# EasyEDA Pro project EVA_RT.eprj, board EVA_RT_JLCPCB
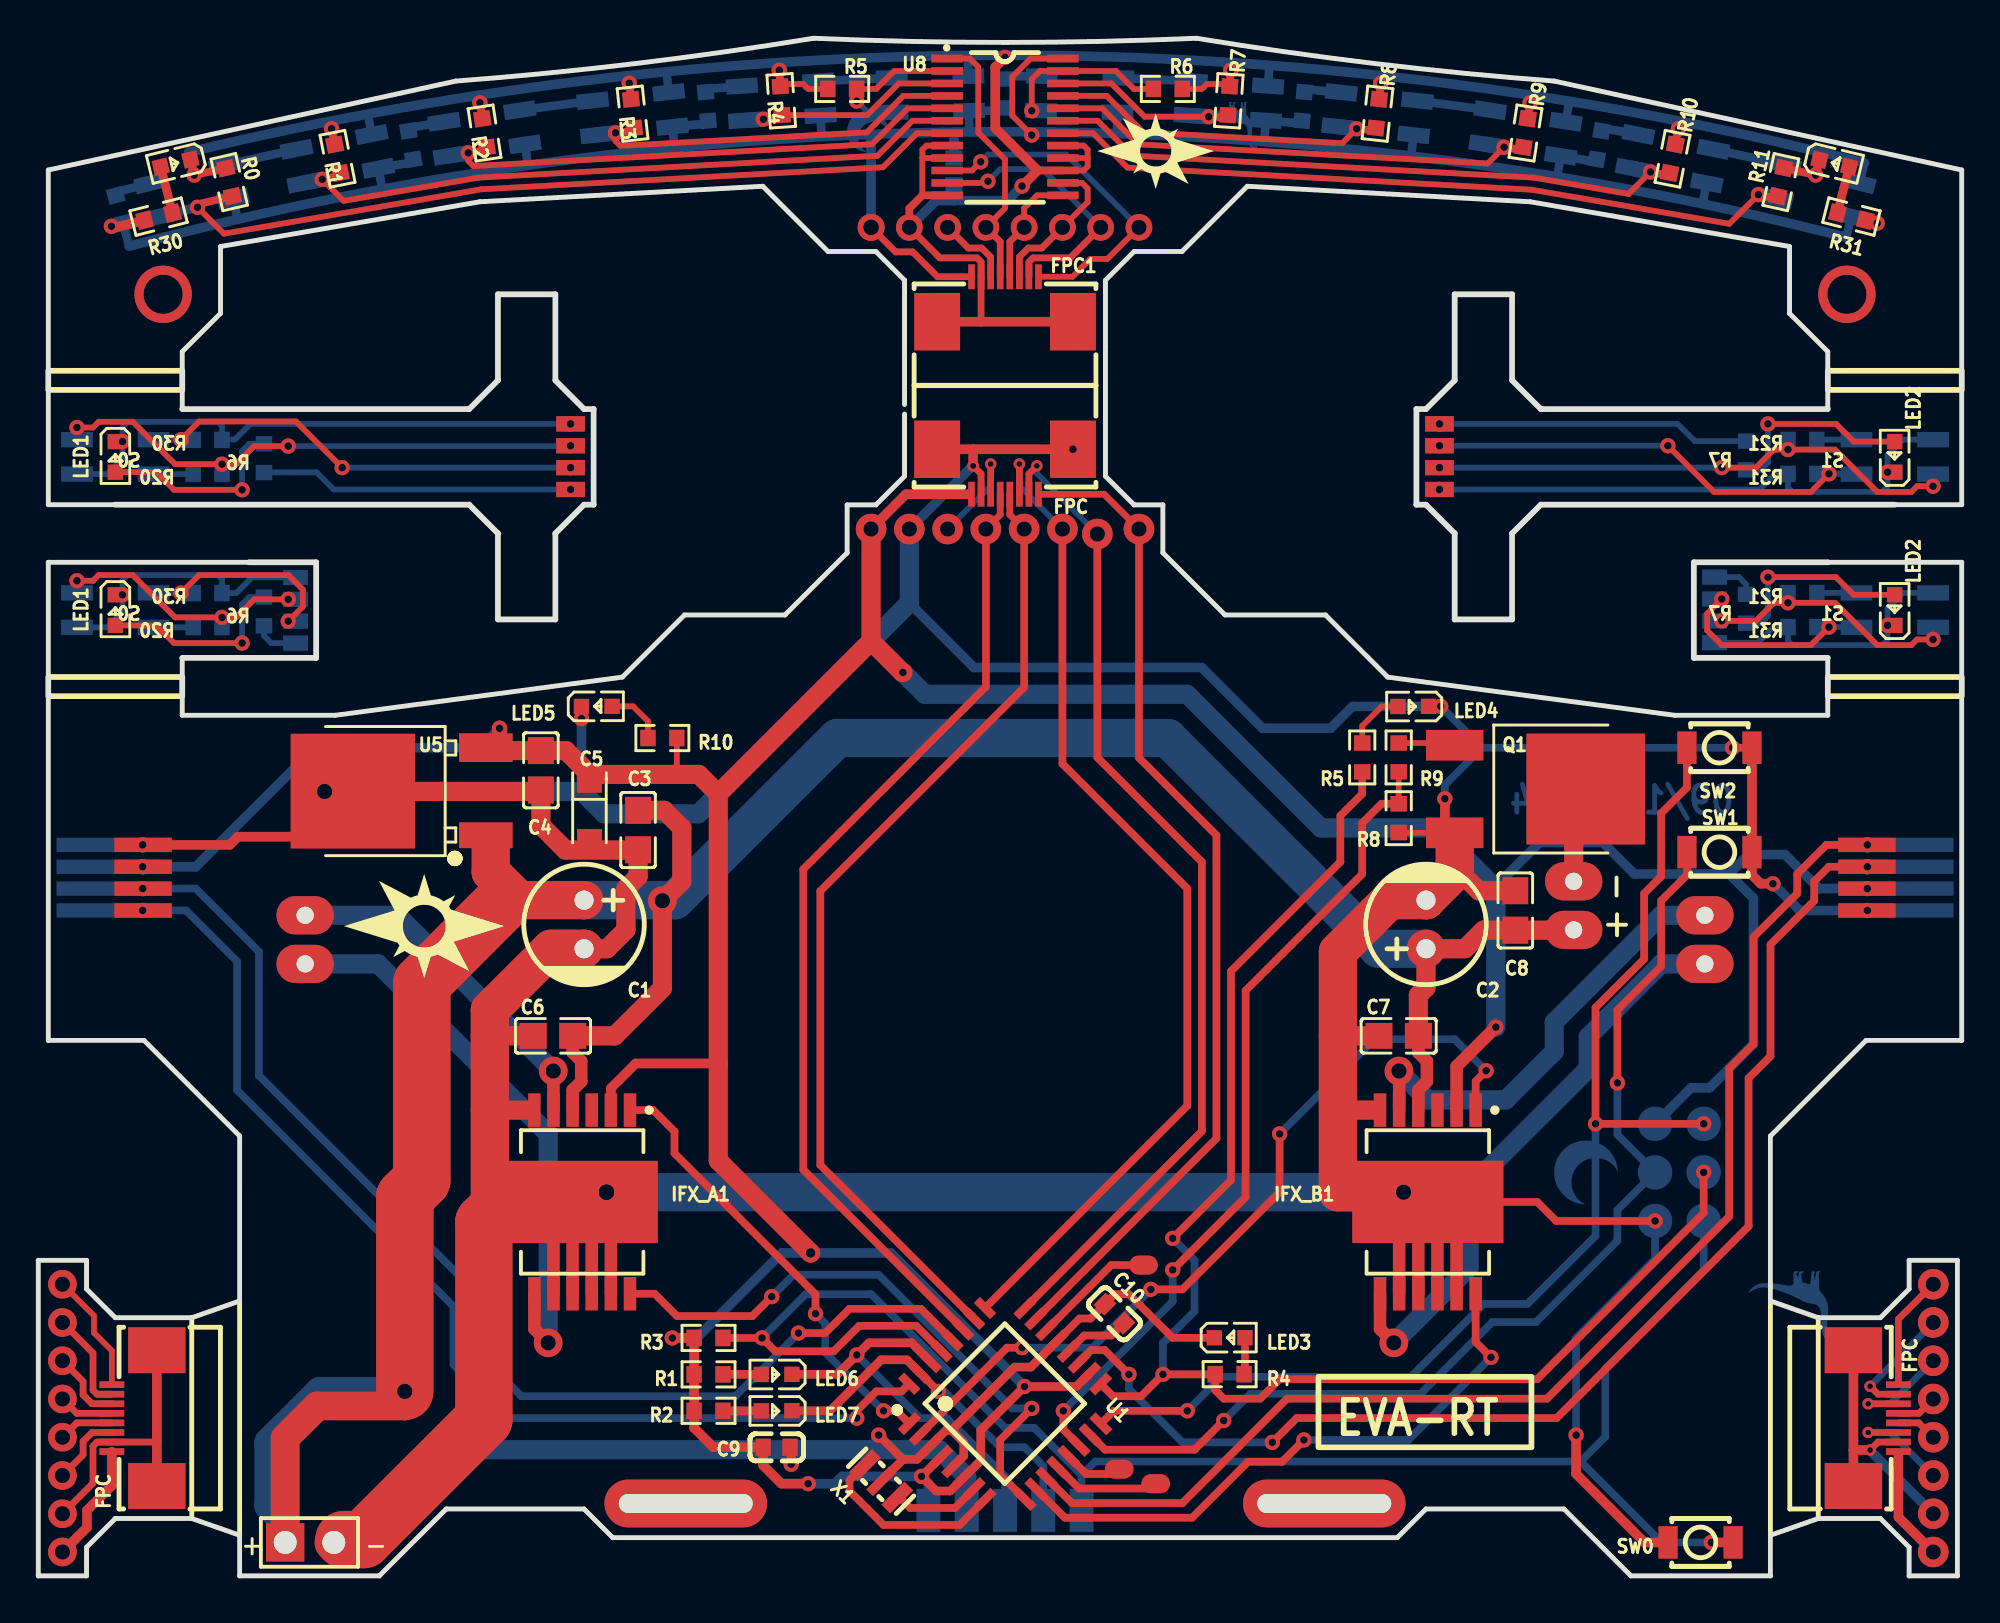
[diagram p6: board, top side]
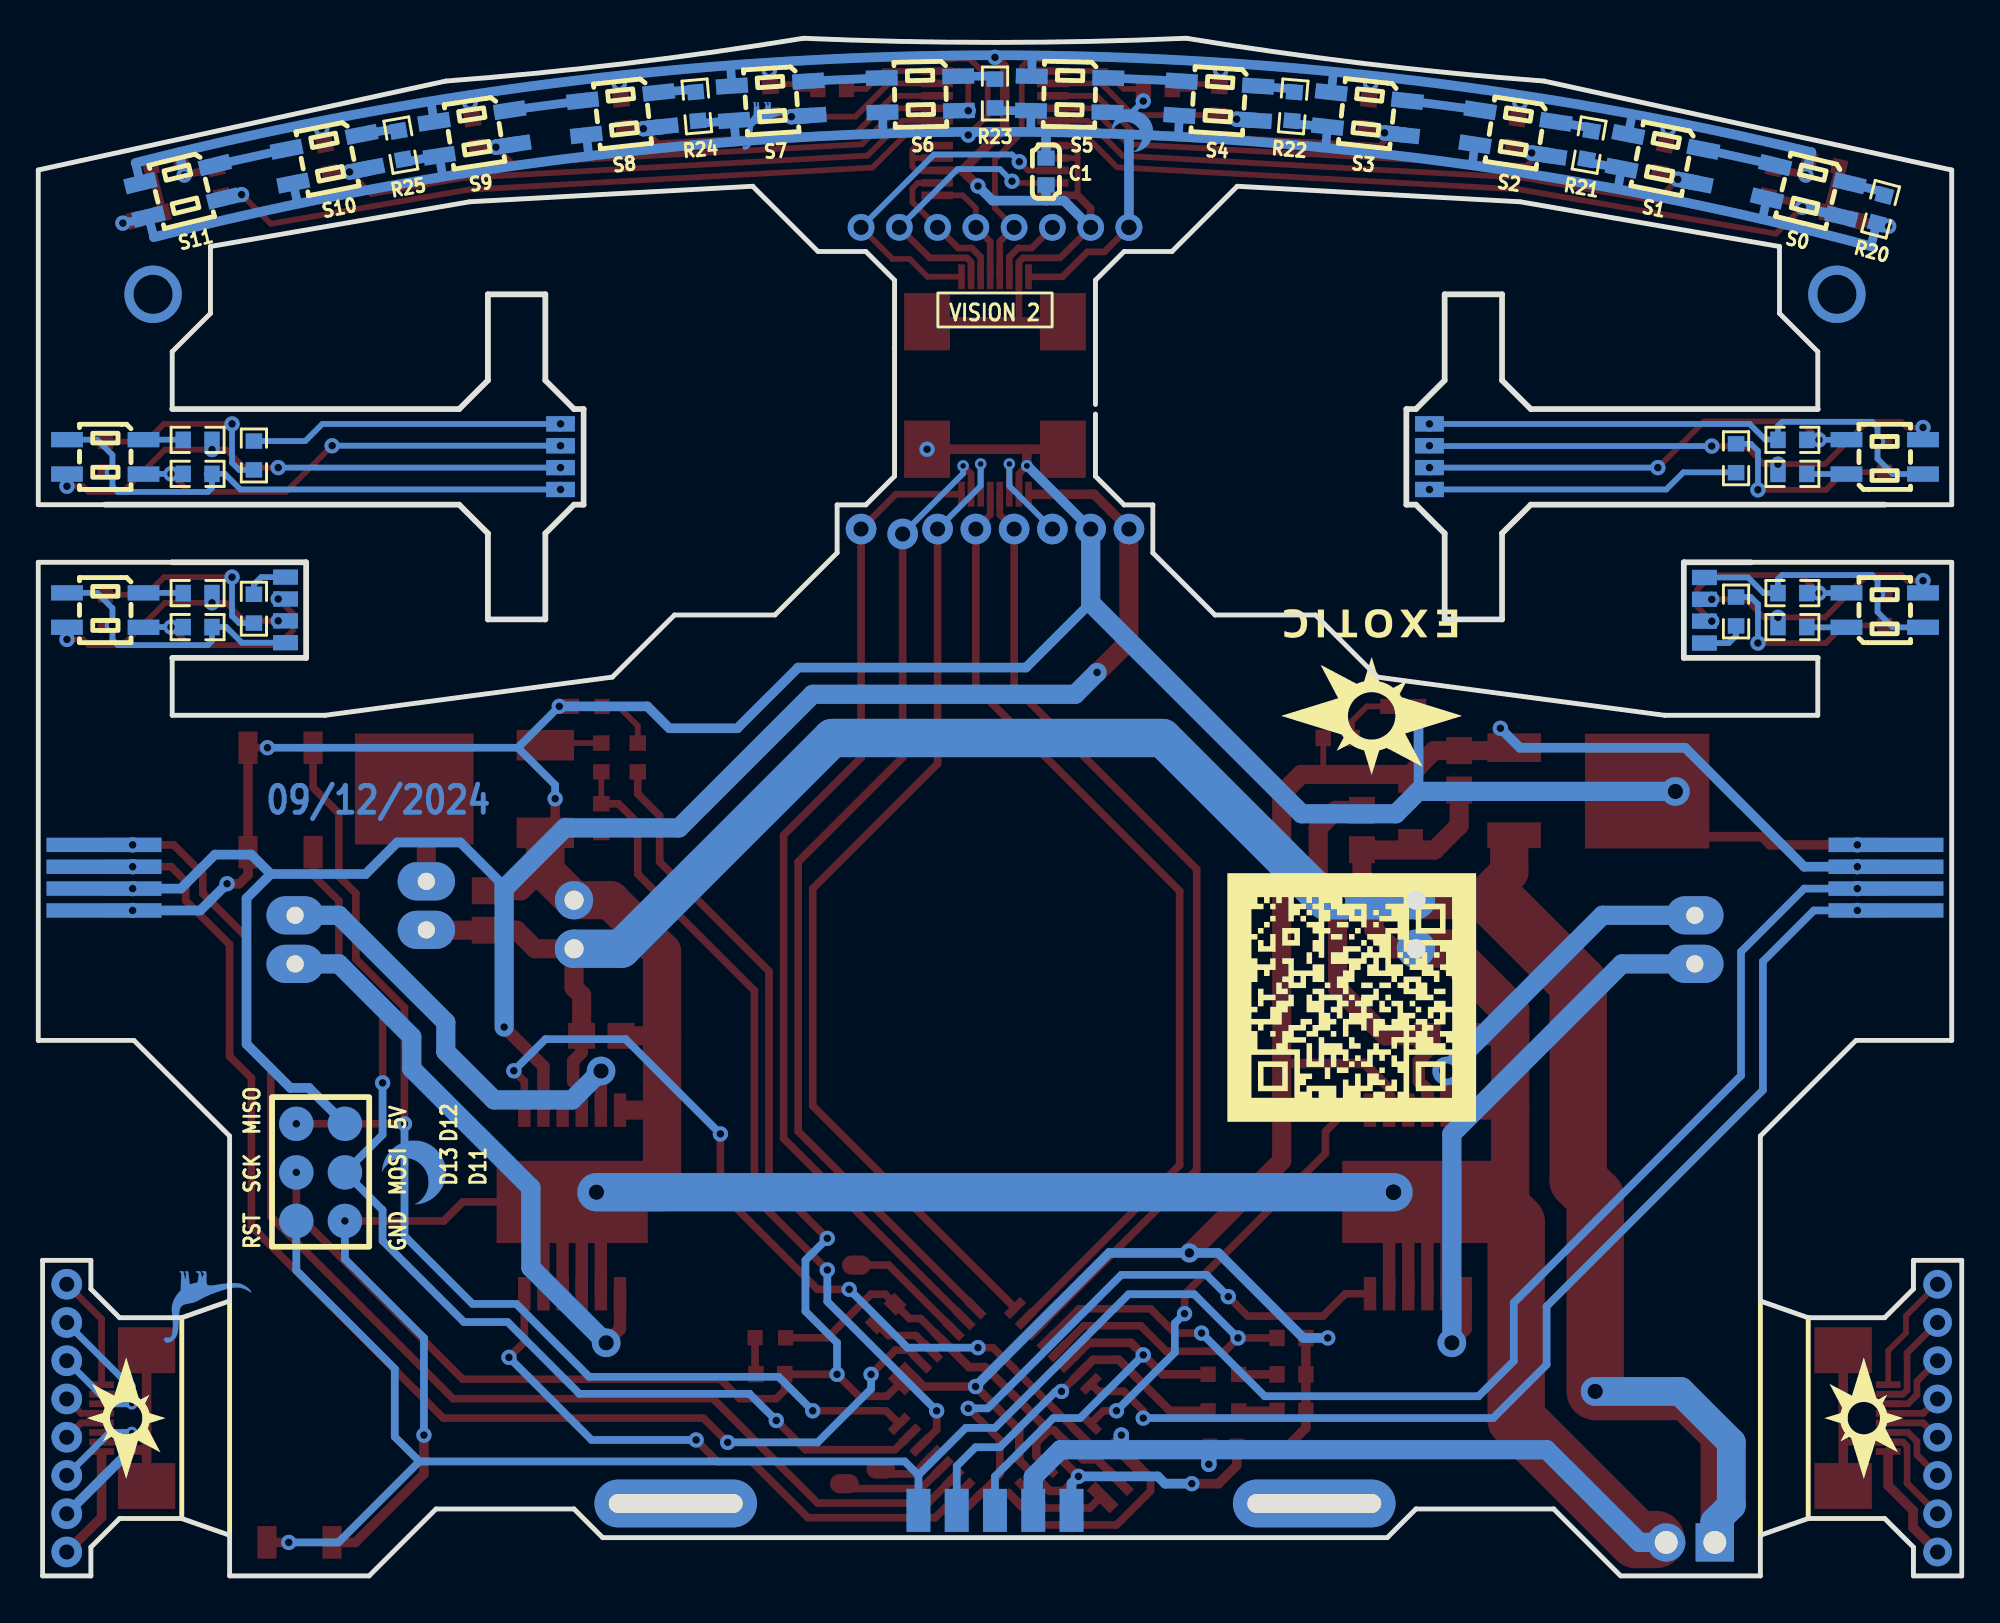
[diagram p7: board, bottom side, seen from below]

Outline 100.52 x 80.4 mm; copper layers: Top Layer, Bottom Layer. Coordinates in mm from the lower left corner of the outline.
Outline path: 45.27,61.25 45.27,67.75 43.77,69.25 41.27,69.25 37.86,72.66 23.07,71.85 9.52,69.51 9.52,66.01 7.52,64.01 7.52,61.01 22.52,61.01 24.02,62.51 24.02,67.01 27.02,67.01 27.02,62.51 28.52,61.01 29.02,61.01 29.02,56.01 28.52,56.01 27.02,54.51 27.02,50.01 24.02,50.01 24.02,54.51 22.52,56.01 0.52,56.01 0.52,73.51 21.82,78.16 arc(31.2,79.08) 40.52,80.4 arc(50.52,80.18) 60.52,80.4 arc(69.85,79.08) 79.22,78.16 100.52,73.51 100.52,56.01 78.52,56.01 77.02,54.51 77.02,50.01 74.02,50.01 74.02,54.51 72.52,56.01 72.02,56.01 72.02,61.01 72.52,61.01 74.02,62.51 74.02,67.01 77.02,67.01 77.02,62.51 78.52,61.01 93.52,61.01 93.52,64.01 91.52,66.01 91.52,69.51 77.97,71.85 63.19,72.66 59.77,69.25 57.27,69.25 55.77,67.75 55.77,57.5 57.27,56 58.77,56 58.77,53.49 62.02,50.24 67.27,50.24 70.52,46.99 85.52,45 93.52,45 93.52,48 86.52,48 86.52,53 93.52,53 100.52,53 100.52,28 95.52,28 90.52,23 90.52,14.38 93.02,13.5 96.27,13.5 97.77,15 97.77,16.5 100.3,16.5 100.3,0 97.77,0 97.77,1.5 96.27,3 93.02,3 90.52,2.12 90.52,0 83.23,0 79.73,3.5 72.52,3.5 71.02,2 30.02,2 28.52,3.5 21.32,3.5 17.82,0 10.52,0 10.52,2.12 8.02,3 4.02,3 2.52,1.5 2.52,0 0,0 0,16.5 2.52,16.5 2.52,15 4.02,13.5 8.02,13.5 10.52,14.38 10.52,23 5.52,28 0.52,28 0.52,53 14.52,53 14.52,48 7.52,48 7.52,45 15.52,45 30.52,46.99 33.77,50.24 39.02,50.24 42.27,53.49 42.27,56 43.77,56 45.27,57.5 45.27,60.75
Stack: Top Layer 0.035mm - / Dielectric1 1.51mm FR4 er 4.5 / Bottom Layer 0.035mm -

## Design rules (mm)
template: JLCPCB Capability(Two Layers Board)
spacing copperThickness1oz (default): track to track 0.102, other pairs 0.152 to 0.3
spacing copperThickness2oz: track to track 0.203, other pairs 0.152 to 0.3
track width copperThickness1oz (default): min 0.127, default 0.254, max 2.54
track width copperThickness2oz: min 0.203, default 0.254, max 2.54
differential pair differentialPair (default): width min 0.127, default 0.254, max 2.54; gap min 0.152, default 0.152
via viaSize (default): diameter min 0.5, default 0.61, max 10; hole min 0.3, default 0.305, max 6.3

## Placement (name value [footprint] x y rotation side)
C1  -  [cap-th_bd6.3-p2.50-d1.0-fd]  28.52 34.06 270 top
C1#2  -  [C0603]  47.86 73.43 90 bottom
C2  220uF  [cap-th_bd6.3-p2.50-d1.0-fd]  72.52 34.06 90 top
C3  220nF  [C0805]  31.35 39 90 top
C4  100nF  [C0805]  26.27 42.12 90 top
C5  47uF  [cap-smd_l3.2-w1.6-rd]  28.81 40 270 top
C6  100nF  [C0805]  26.9 28.24 0 top
C7  100nF  [C0805]  71.1 28.24 0 top
C8  100nF  [C0805]  77.19 34.79 270 top
C9  100nF  [C0603]  38.59 6.73 180 top
C10  100nF  [C0603]  56.24 13.71 135 top
FPC  -  [FFC-SMD_FFC05001-08SBA124W5M]  50.52 57.73 180 top
FPC1  FFC05001-08SBA124W5M  [FFC-SMD_FFC05001-08SBA124W5M]  50.52 66.75 0 top
FPC#2  -  [FFC-SMD_FFC05001-08SBA124W5M]  96.04 8.25 270 top
FPC#3  -  [FFC-SMD_FFC05001-08SBA124W5M]  5.02 8.25 90 top
IFX_A1  -  [PG-DSO-12-17]  28.43 19.55 270 top
IFX_B1  -  [PG-DSO-12-17]  72.62 19.55 270 top
LED1  -  [LED0603-RD_RED]  4.02 58.51 270 top
LED1#2  -  [LED0603-RD_RED]  4.02 50.5 270 top
LED1#3  -  [LED0603-RD_RED]  7.18 73.87 193.7 top
LED2  -  [LED0603-RD_RED]  93.87 73.86 346.3 top
LED2#2  -  [LED0603-RD_RED]  97.02 50.5 90 top
LED2#3  -  [LED0603-RD_RED]  97.02 58.51 90 top
LED3  XL-1608SURC-06  [LED0603-RD_RED]  62.26 12.45 0 top
LED4  XL-1608SURC-06  [LED0603-RD_RED]  71.86 45.46 180 top
LED5  XL-1608SURC-06  [LED0603-RD_RED]  29.19 45.46 0 top
LED6  XL-1608SURC-06  [LED0603-RD_RED]  38.59 10.54 180 top
LED7  XL-1608SURC-06  [LED0603-RD_RED]  38.59 8.63 180 top
NOREF  -  [Pad_e848]  87.6 52.22 90 top
NOREF#2  -  [Pad_e700]  73.23 57.95 90 top
NOREF#3  -  [Pad_e838]  87.04 23.64 180 top
NOREF#4  -  [Pad_e619]  67.21 3.79 270 top
NOREF#5  -  [Pad_e233]  27.82 56.81 90 top
NOREF#6  -  [Pad_e850]  87.6 49.94 90 top
NOREF#7  -  [Pad_e37]  27.82 60.23 90 top
NOREF#8  -  [Pad_e699]  73.23 57.95 90 top
NOREF#9  -  [Pad_e394]  50.52 3.43 0 top
NOREF#10  -  [Pad_e74]  3.96 37.08 90 top
NOREF#11  -  [Pad_e75]  5.48 37.08 90 top
NOREF#12  -  [Pad_e57]  3.96 34.79 90 top
NOREF#13  -  [Pad_e562]  58.4 4.82 90 top
NOREF#14  -  [Pad_e1014]  97.09 34.79 90 top
NOREF#15  -  [Pad_e513]  54.52 3.43 0 top
NOREF#16  -  [Pad_e83]  3.96 38.22 90 top
NOREF#17  -  [Pad_e393]  48.52 3.43 0 top
NOREF#18  -  [Pad_e1013]  97.09 38.22 90 top
NOREF#19  -  [Pad_e1011]  97.09 37.08 90 top
NOREF#20  -  [Pad_e701]  73.23 59.09 90 top
NOREF#21  -  [Pad_e840]  87.04 21.1 90 top
NOREF#22  -  [Pad_e763]  80.24 33.78 0 top
NOREF#23  -  [Pad_e697]  73.23 56.81 90 top
NOREF#24  -  [Pad_e843]  87.1 34.54 0 top
NOREF#25  -  [Pad_e693]  73.23 59.09 90 top
NOREF#26  -  [Pad_e430]  33.84 3.79 270 top
NOREF#27  -  [Pad_e61]  5.48 34.79 90 top
NOREF#28  -  [Pad_e973]  95.57 37.08 90 top
NOREF#29  -  [Pad_e537]  56.49 5.58 90 top
NOREF#30  -  [Pad_e762]  80.24 36.32 0 top
NOREF#31  -  [Pad_e201]  27.82 57.95 90 top
NOREF#32  -  [Pad_e691]  73.23 60.23 90 top
NOREF#33  -  [Pad_e844]  87.1 32 0 top
NOREF#34  -  [Pad_e84]  5.48 38.22 90 top
NOREF#35  -  [Pad_e36]  27.82 60.23 90 top
NOREF#36  -  [Pad_e199]  27.82 57.95 90 top
NOREF#37  -  [Pad_e392]  46.52 3.43 0 top
NOREF#38  -  [Pad_e841]  87.04 18.56 180 top
NOREF#39  -  [Pad_e121]  13.45 49.92 270 top
NOREF#40  -  [Pad_e1062]  27.82 59.09 90 top
NOREF#41  -  [Pad_e698]  73.23 60.23 90 top
NOREF#42  -  [Pad_e491]  52.52 3.43 0 top
NOREF#43  -  [Pad_e809]  84.5 21.1 180 top
NOREF#44  -  [Pad_e1061]  27.82 59.09 90 top
NOREF#45  -  [Pad_e55]  13.95 34.54 180 top
NOREF#46  -  [Pad_e974]  95.57 38.22 90 top
NOREF#47  -  [Pad_e184]  13.95 32 180 top
NOREF#48  -  [Pad_e67]  3.96 35.94 90 top
NOREF#49  -  [Pad_e454]  13.45 52.21 270 top
NOREF#50  -  [Pad_e851]  87.6 48.79 90 top
NOREF#51  -  [Pad_e552]  57.76 16.25 90 top
NOREF#52  -  [Pad_e810]  84.5 18.56 180 top
NOREF#53  -  [Pad_e852]  87.6 51.08 90 top
NOREF#54  -  [Pad_e232]  27.82 56.81 90 top
NOREF#55  -  [Pad_e19]  13.45 51.06 270 top
NOREF#56  -  [Pad_e975]  95.57 34.79 90 top
NOREF#57  -  [Pad_e70]  5.48 35.94 90 top
NOREF#58  -  [Pad_e695]  73.23 56.81 90 top
NOREF#59  -  [Pad_e811]  84.5 23.64 0 top
NOREF#60  -  [Pad_e154]  13.45 48.78 270 top
NOREF#61  -  [Pad_e976]  95.57 35.94 90 top
NOREF#62  -  [Pad_e1012]  97.09 35.94 90 top
Q1  IRFR3411TR-VB  [TO-252-2_L6.6-W6.1-P4.57-LS9.9-BR-CW]  77.45 41.14 180 top
R0  47kΩ  [R0603]  9.98 72.88 103.1 top
R1  -  [R0603]  15.64 74.1 101.2 top
R1#2  -  [R0603]  35.03 10.54 0 top
R2  -  [R0603]  23.32 75.44 98.7 top
R2#2  -  [R0603]  35.03 8.63 0 top
R3  -  [R0603]  31.06 76.46 96.2 top
R3#2  -  [R0603]  35.03 12.44 0 top
R4  -  [R0603]  38.83 77.13 93.7 top
R4#2  -  [R0603]  62.26 10.55 0 top
R5  -  [R0603]  42.02 77.75 180 top
R5#2  -  [R0603]  69.19 42.8 90 top
R6  -  [R0603]  59.03 77.75 0 top
R6#2  -  [R0603]  11.79 50.43 90 bottom
R6#3  -  [R0603]  11.79 58.44 90 bottom
R7  -  [R0603]  62.22 77.13 86.3 top
R7#2  -  [R0603]  89.25 50.57 270 bottom
R7#3  -  [R0603]  89.25 58.58 270 bottom
R8  -  [R0603]  69.99 76.46 83.8 top
R8#2  -  [R0603]  71.1 39.62 270 top
R9  -  [R0603]  77.72 75.44 81.3 top
R9#2  -  [R0603]  71.1 42.8 270 top
R10  -  [R0603]  85.41 74.1 78.8 top
R10#2  -  [R0603]  32.62 43.81 0 top
R11  47kΩ  [R0603]  91.07 72.88 77.6 top
R20  -  [R0603]  8.85 49.61 180 bottom
R20#2  -  [R0603]  4.24 71.46 104.9 bottom
R20#3  -  [R0603]  8.85 57.62 180 bottom
R21  -  [R0603]  19.47 74.81 99.9 bottom
R21#2  -  [R0603]  92.2 51.39 0 bottom
R21#3  -  [R0603]  92.2 59.4 0 bottom
R22  100Ω  [R0603]  34.94 76.84 95 bottom
R23  100Ω  [R0603]  50.52 77.51 90 bottom
R24  100Ω  [R0603]  66.11 76.84 85 bottom
R25  100Ω  [R0603]  81.57 74.81 80.1 bottom
R30  -  [R0603]  6.29 71.07 14.3 top
R30#2  -  [R0603]  8.85 59.4 180 bottom
R30#3  -  [R0603]  8.85 51.39 180 bottom
R31  -  [R0603]  94.76 71.07 165.7 top
R31#2  -  [R0603]  92.2 49.61 0 bottom
R31#3  -  [R0603]  92.2 57.62 0 bottom
S0  -  [OPTO-SMD_QRE1113GR]  8.02 72.42 13.7 bottom
S0#2  -  [OPTO-SMD_QRE1113GR]  4.02 58.51 180 bottom
S0#3  -  [OPTO-SMD_QRE1113GR]  4.02 50.5 180 bottom
S1  -  [OPTO-SMD_QRE1113GR]  15.64 74.1 11.2 bottom
S1#2  -  [OPTO-SMD_QRE1113GR]  97.02 50.5 0 bottom
S1#3  -  [OPTO-SMD_QRE1113GR]  97.02 58.51 0 bottom
S2  QRE1113GR  [OPTO-SMD_QRE1113GR]  23.32 75.44 8.7 bottom
S3  QRE1113GR  [OPTO-SMD_QRE1113GR]  31.06 76.46 6.2 bottom
S4  QRE1113GR  [OPTO-SMD_QRE1113GR]  38.83 77.13 3.7 bottom
S5  QRE1113GR  [OPTO-SMD_QRE1113GR]  46.62 77.47 1.2 bottom
S6  QRE1113GR  [OPTO-SMD_QRE1113GR]  54.42 77.47 358.8 bottom
S7  QRE1113GR  [OPTO-SMD_QRE1113GR]  62.22 77.13 356.3 bottom
S8  QRE1113GR  [OPTO-SMD_QRE1113GR]  69.99 76.46 353.8 bottom
S9  QRE1113GR  [OPTO-SMD_QRE1113GR]  77.72 75.44 351.3 bottom
S10  QRE1113GR  [OPTO-SMD_QRE1113GR]  85.41 74.1 348.8 bottom
S11  QRE1113GR  [OPTO-SMD_QRE1113GR]  93.03 72.42 346.3 bottom
SW0  B3U-1000P  [key-smd_b3u-1000pm]  86.87 1.75 180 top
SW1  B3U-1000P  [key-smd_b3u-1000pm]  87.86 37.84 0 top
SW2  B3U-1000P  [key-smd_b3u-1000pm]  87.86 43.3 0 top
U1  ATMEGA328P-AU  [tqfp-32_l7.0-w7.0-p0.80-ls9.0-bl]  50.52 9 315 top
U5  78M05  [TO-252-2_L6.5-W6.1-P4.58-LS10.0-TL]  19.92 41.02 180 top
U8  74HCT4067PW,118  [TSSOP-24_L7.8-W4.4-P0.65-LS6.4-BL]  50.52 75.76 270 top
VIN  KH-2.54PH180-1X2P-L11.5  [hdr-th_2p-p2.54-v-m]  14.17 1.75 0 top
X1  16MHz  [OSC-SMD_3P-L3.2-W1.3-P1.2-L]  44.05 4.95 135 top

## Footprints (pads in the part's own frame, mm; a bottom-side part is the same pattern mirrored in y, then rotated)
C0603
  rect 0.8x0.9 smd: 1(-0.7,0) 2(0.7,0)
C0805
  rect 1.41x1.35 smd: 1(-1.03,0) 2(1.03,0)
cap-smd_l3.2-w1.6-rd
  rect 1x1.296 smd: 1(-1.449,0) 2(1.449,0)
cap-th_bd6.3-p2.50-d1.0-fd
  round 2 hole 1x0.9: 1(-1.27,0) 2(1.27,0)
FFC-SMD_FFC05001-08SBA124W5M
  rect 0.35x1.3 smd: 1(1.75,1.175) 2(1.25,1.175) 3(0.75,1.175) 4(0.25,1.175) 5(-0.25,1.175) 6(-0.75,1.175) 7(-1.25,1.175) 8(-1.75,1.175)
  rect 2.4x3 smd: 9(-3.55,-1.175) 10(3.55,-1.175)
hdr-th_2p-p2.54-v-m
  rect 2x2 hole 1.2x0.9: 1(-1.27,0)
  round 2 hole 1.2x0.9: 2(1.27,0)
key-smd_b3u-1000pm
  rect 1x1.7 smd: 1(-1.7,0) 2(1.7,0)
LED0603-RD_RED
  rect 0.8x0.8 smd: 1(-0.799,-0.004) 2(0.799,0.004)
OPTO-SMD_QRE1113GR
  rect 1.66x0.8 smd: 1(-2,-0.9) 2(2,-0.9) 3(2,0.9) 4(-2,0.9)
OSC-SMD_3P-L3.2-W1.3-P1.2-L
  rect 0.65x1.7 smd: 1(-1.2,0) 3(1.2,0)
  rect 0.5x1.7 smd: 2(0,0)
Pad_e19
  rect 0.8x1.3 smd far side: 1(0,0)
Pad_e36
  rect 0.8x1.5 smd far side: 1(0,0)
Pad_e37
  rect 0.8x1.5 smd: 1(0,0)
Pad_e55
  oval 3x2 hole 0.9: 1(0,0)
Pad_e57
  rect 0.75x6 smd far side: 1(0,0)
Pad_e61
  rect 0.75x3 smd: 1(0,0)
Pad_e67
  rect 0.75x6 smd far side: 1(0,0)
Pad_e70
  rect 0.75x3 smd: 1(0,0)
Pad_e74
  rect 0.75x6 smd far side: 1(0,0)
Pad_e75
  rect 0.75x3 smd: 1(0,0)
Pad_e83
  rect 0.75x6 smd far side: 1(0,0)
Pad_e84
  rect 0.75x3 smd: 1(0,0)
Pad_e121
  rect 0.8x1.3 smd far side: 1(0,0)
Pad_e154
  rect 0.8x1.3 smd far side: 1(0,0)
Pad_e184
  oval 3x2 hole 0.9: 1(0,0)
Pad_e199
  rect 0.8x1.5 smd far side: 1(0,0)
Pad_e201
  rect 0.8x1.5 smd: 1(0,0)
Pad_e232
  rect 0.8x1.5 smd: 1(0,0)
Pad_e233
  rect 0.8x1.5 smd far side: 1(0,0)
Pad_e392
  rect 1.25x2.25 smd far side: 33(0,0)
Pad_e393
  rect 1.25x2.25 smd far side: 33(0,0)
Pad_e394
  rect 1.25x2.25 smd far side: 33(0,0)
Pad_e430
  oval 2.5x8.5 hole 1x7: 1(0,0)
Pad_e454
  rect 0.8x1.3 smd far side: 1(0,0)
Pad_e491
  rect 1.25x2.25 smd far side: 33(0,0)
Pad_e513
  rect 1.25x2.25 smd far side: 33(0,0)
Pad_e537
  oval 1x1.5 smd: 1(0,0)
Pad_e552
  oval 1x1.5 smd: 1(0,0)
Pad_e562
  oval 1x1.5 smd: 1(0,0)
Pad_e619
  oval 2.5x8.5 hole 1x7: 1(0,0)
Pad_e691
  rect 0.8x1.5 smd far side: 1(0,0)
Pad_e693
  rect 0.8x1.5 smd far side: 1(0,0)
Pad_e695
  rect 0.8x1.5 smd: 1(0,0)
Pad_e697
  rect 0.8x1.5 smd far side: 1(0,0)
Pad_e698
  rect 0.8x1.5 smd: 1(0,0)
Pad_e699
  rect 0.8x1.5 smd far side: 1(0,0)
Pad_e700
  rect 0.8x1.5 smd: 1(0,0)
Pad_e701
  rect 0.8x1.5 smd: 1(0,0)
Pad_e762
  oval 3x2 hole 0.9: 1(0,0)
Pad_e763
  oval 3x2 hole 0.9: 1(0,0)
Pad_e809
  round 1.8 smd far side: 1(0,0)
Pad_e810
  round 1.8 smd far side: 1(0,0)
Pad_e811
  round 1.8 smd far side: 1(0,0)
Pad_e838
  round 1.8 smd far side: 1(0,0)
Pad_e840
  round 1.8 smd far side: 1(0,0)
Pad_e841
  round 1.8 smd far side: 1(0,0)
Pad_e843
  oval 3x2 hole 0.9: 1(0,0)
Pad_e844
  oval 3x2 hole 0.9: 1(0,0)
Pad_e848
  rect 0.8x1.3 smd far side: 1(0,0)
Pad_e850
  rect 0.8x1.3 smd far side: 1(0,0)
Pad_e851
  rect 0.8x1.3 smd far side: 1(0,0)
Pad_e852
  rect 0.8x1.3 smd far side: 1(0,0)
Pad_e973
  rect 0.75x3 smd: 1(0,0)
Pad_e974
  rect 0.75x3 smd: 1(0,0)
Pad_e975
  rect 0.75x3 smd: 1(0,0)
Pad_e976
  rect 0.75x3 smd: 1(0,0)
Pad_e1011
  rect 0.75x6 smd far side: 1(0,0)
Pad_e1012
  rect 0.75x6 smd far side: 1(0,0)
Pad_e1013
  rect 0.75x6 smd far side: 1(0,0)
Pad_e1014
  rect 0.75x6 smd far side: 1(0,0)
Pad_e1061
  rect 0.8x1.5 smd: 1(0,0)
Pad_e1062
  rect 0.8x1.5 smd far side: 1(0,0)
PG-DSO-12-17
  rect 1.75x0.65 smd: 1(-4.8,2.5) 2(-4.8,1.5) 3(-4.8,0.5) 4(-4.8,-0.5) 5(-4.8,-1.5) 6(-4.8,-2.5) 7(4.8,-2.5) 8(4.8,-1.5) 9(4.8,-0.5) 10(4.8,0.5) 11(4.8,1.5) 12(4.8,2.5)
  rect 4.3x7.9 smd: 13(0,0)
R0603
  rect 0.806x0.864 smd: 1(-0.753,0) 2(0.753,0)
TO-252-2_L6.5-W6.1-P4.58-LS10.0-TL
  rect 2.8x1.35 smd: 1(-3.475,2.29)
  rect 2.8x1.5 smd: 3(-3.475,-2.29)
  rect 6.5x6 smd: 4(3.475,-0.017)
TO-252-2_L6.6-W6.1-P4.57-LS9.9-BR-CW
  rect 3x1.6 smd: 1(3.424,-2.29) 3(3.424,2.29)
  rect 6.2x5.8 smd: 2(-3.424,0)
tqfp-32_l7.0-w7.0-p0.80-ls9.0-bl
  rect 0.45x1.25 smd: 1(-2.8,-4.269) 2(-2,-4.269) 3(-1.2,-4.269) 4(-0.4,-4.269) 5(0.4,-4.269) 6(1.2,-4.269) 7(2,-4.269) 8(2.8,-4.269) 17(2.8,4.269) 18(2,4.269) 19(1.2,4.269) 20(0.4,4.269) 21(-0.4,4.269) 22(-1.2,4.269) 23(-2,4.269) 24(-2.8,4.269)
  rect 1.25x0.45 smd: 9(4.282,-2.8) 10(4.282,-2) 11(4.282,-1.2) 12(4.282,-0.4) 13(4.282,0.4) 14(4.282,1.2) 15(4.282,2) 16(4.282,2.8)
  rect 1.2x0.45 smd: 25(-4.281,2.8) 26(-4.281,2) 27(-4.281,1.2) 28(-4.281,0.4) 29(-4.281,-0.4) 30(-4.281,-1.2) 31(-4.281,-2) 32(-4.281,-2.8)
TSSOP-24_L7.8-W4.4-P0.65-LS6.4-BL
  rect 0.4x1.65 smd: 1(-3.575,-3.022) 2(-2.925,-3.022) 3(-2.275,-3.022) 4(-1.625,-3.022) 5(-0.975,-3.022) 6(-0.325,-3.022) 7(0.325,-3.022) 8(0.975,-3.022) 9(1.625,-3.022) 10(2.275,-3.022) 11(2.925,-3.022) 12(3.575,-3.022) 13(3.575,3.022) 14(2.925,3.022) 15(2.275,3.022) 16(1.625,3.022) 17(0.975,3.022) 18(0.325,3.022) 19(-0.325,3.022) 20(-0.975,3.022) 21(-1.625,3.022) 22(-2.275,3.022) 23(-2.925,3.022) 24(-3.575,3.022)

## Nets
5V: C4.2 C5.1 C9.2 FPC.1 IFX_A1.2 IFX_B1.2 NOREF#2.1 NOREF#6.1 NOREF#8.1 NOREF#10.1 NOREF#11.1 NOREF#37.33 NOREF#40.1 NOREF#44.1 NOREF#55.1 NOREF#59.1 NOREF#61.1 NOREF#62.1 R1#2.1 R2#2.1 R3#2.1 R10#2.2 R20.1 R20#3.1 R21#2.1 R21#3.1 S0#2.3 S0#3.3 S1#2.3 S1#3.3 U1.4 U1.6 U1.18 U5.3
GND: C1.2 C1#2.1 C2.2 C3.1 C4.1 C5.2 C6.1 C7.1 C8.1 C9.1 C10.2 FPC.2 FPC.9 FPC.10 FPC1.7 FPC1.9 FPC1.10 IFX_A1.6 IFX_A1.8 IFX_A1.9 IFX_A1.10 IFX_A1.11 IFX_A1.13 IFX_B1.6 IFX_B1.8 IFX_B1.9 IFX_B1.10 IFX_B1.11 IFX_B1.13 LED1.1 LED1#2.1 LED1#3.1 LED2.1 LED2#2.1 LED2#3.1 LED3.1 LED4.1 LED5.1 NOREF#7.1 NOREF#14.1 NOREF#16.1 NOREF#17.33 NOREF#23.1 NOREF#34.1 NOREF#35.1 NOREF#49.1 NOREF#50.1 NOREF#52.1 NOREF#56.1 NOREF#58.1 Q1.3 R0.2 R1.2 R2.2 R3.2 R4.2 R5.2 R6.2 R7.2 R8.2 R8#2.2 R9.2 R10.2 R11.2 R30#2.1 R30#3.1 R31#2.1 R31#3.1 S0#2.2 S0#3.2 S1.2 S1#2.2 S1#3.2 S3.2 S5.2 S7.2 S9.2 S11.2 SW0.2 SW1.2 SW2.2 U1.3 U1.5 U1.21 U5.4 U8.8 U8.9 U8.12 U8.15 U8.16 U8.17 VIN.2 X1.2
VCC: C1#2.2 FPC1.8 R20#2.1 R21.1 R22.1 R23.1 R24.1 R25.1 R30.1 R31.1 S0.3 S1.3 S2.3 S3.3 S4.3 S5.3 S6.3 S7.3 S8.3 S9.3 S10.3 S11.3 U8.24
$LED1_2: LED1.2 LED1#2.2 LED1#3.2 R6#2.2 R6#3.2 R30.2
$LED2_2: LED2.2 LED2#2.2 LED2#3.2 R7#2.2 R7#3.2 R31.2
$LED3_2: LED3.2 R4#2.2
$LED4_2: LED4.2 R5#2.2
$LED5_2: LED5.2 R10#2.1
$LED6_2: LED6.2 R1#2.2
$LED7_2: LED7.2 R2#2.2
$Q1_1: Q1.1 R9#2.1
$R20_2: R20.2 R20#2.2 R20#3.2 S0.1 S0#2.1 S0#3.1
$R21_2: R21.2 R21#2.2 R21#3.2 S1#2.1 S1#3.1 S2.1
$R22_2: R22.2 S4.1
$R23_2: R23.2 S6.1
$R24_2: R24.2 S8.1
$R25_2: R25.2 S10.1
$S0_2: S0.2 S1.1
$S2_2: S2.2 S3.1
$S4_2: S4.2 S5.1
$S6_2: S6.2 S7.1
$S8_2: S8.2 S9.1
$S10_2: S10.2 S11.1
$U1_7: U1.7 X1.1
$U1_8: U1.8 X1.3
AREF: C10.1 U1.20
B1/D11: NOREF#43.1 SW1.1 U1.15
B2/D12: NOREF#3.1 SW2.1 U1.16
C0: FPC1.5 U8.1
C0/A4: FPC.4 U1.27
DIRA/D3: IFX_A1.1 U1.1
DIRB/D4: IFX_B1.1 U1.2
LED1/D2: NOREF#5.1 NOREF#12.1 NOREF#27.1 NOREF#54.1 NOREF#60.1 R6#2.1 R6#3.1 U1.32
LED2/D7: NOREF.1 NOREF#18.1 NOREF#32.1 NOREF#41.1 NOREF#46.1 R7#2.1 R7#3.1 U1.11
LED3/D13: NOREF#21.1 R4#2.1 R5#2.1 U1.17
OUT_A1: IFX_A1.5 NOREF#45.1
OUT_A2: IFX_A1.7 NOREF#47.1
OUT_B1: IFX_B1.5 NOREF#24.1
OUT_B2: IFX_B1.7 NOREF#33.1
OUT_C: NOREF#30.1 Q1.2
P3: FPC.3
P6: FPC1.6
PWMA/D5: IFX_A1.12 U1.9
PWMB/D6: IFX_B1.12 U1.10
PWMC/D10: R8#2.1 R9#2.2 U1.14
RESET: NOREF#15.33 NOREF#38.1 R3#2.2 SW0.1 U1.29
RX/D0: LED6.1 NOREF#9.33 U1.30
S0: FPC1.1 U8.10
S0/A0: FPC.8 U1.23
S1: FPC1.2 U8.11
S1/A1: FPC.7 U1.24
S2: FPC1.3 U8.14
S2/A2: FPC.6 U1.25
S3: FPC1.4 U8.13
S3/A3: FPC.5 U1.26
TX/D1: LED7.1 NOREF#42.33 U1.31
VS: C1.1 C2.1 C3.2 C6.2 C7.2 C8.2 IFX_A1.4 IFX_B1.4 NOREF#22.1 U5.1 VIN.1
Y0: R0.1 S0.4 U8.7
Y0/A5: NOREF#31.1 NOREF#36.1 NOREF#39.1 NOREF#48.1 NOREF#57.1 R30#2.2 R30#3.2 S0#2.4 S0#3.4 U1.28
Y1: R1.1 S1.4 U8.6
Y1/A6: NOREF#19.1 NOREF#20.1 NOREF#25.1 NOREF#28.1 NOREF#53.1 R31#2.2 R31#3.2 S1#2.4 S1#3.4 U1.19
Y2: R2.1 S2.4 U8.5
Y3: R3.1 S3.4 U8.4
Y4: R4.1 S4.4 U8.3
Y5: R5.1 S5.4 U8.2
Y6: R6.1 S6.4 U8.23
Y7: R7.1 S7.4 U8.22
Y8: R8.1 S8.4 U8.21
Y9: R9.1 S9.4 U8.20
Y10: R10.1 S10.4 U8.19
Y11: R11.1 S11.4 U8.18

Pads without a net: FPC#2 1 2 3 4 5 6 7 8 9 10; FPC#3 1 2 3 4 5 6 7 8 9 10; IFX_A1 3; IFX_B1 3; NOREF#4 1; NOREF#13 1; NOREF#26 1; NOREF#29 1; NOREF#51 1; U1 12 13 22

## Via types
v1: diameter 0.6, hole 0.3, Top Layer to Bottom Layer, 9 vias
v2: diameter 1.5, hole 0.8, Top Layer to Bottom Layer, 19 vias
v3: diameter 3, hole 2.05, Top Layer to Bottom Layer, 2 vias
v4: diameter 1.6, hole 0.8, Top Layer to Bottom Layer, 16 vias
v5: diameter 0.8, hole 0.4, Top Layer to Bottom Layer, 118 vias
v6: diameter 1.4, hole 0.8, Top Layer to Bottom Layer, 9 vias
v7: diameter 1, hole 0.5, Top Layer to Bottom Layer, 1 via

## Routing (per net, layer and track width the routed paths; a pad name or vN(x,y) marks a point on that pad's centre or on a via; arc(x,y) is an arc through that point)
5V: length 323.1
  Top Layer w0.3: v5(2.02,60.05) 2.86,60.05 3.16,60.34 4.94,60.34 7.15,58.13 v5(9.6,58.13) 10.34,58.13 11.29,59.07 v5(13.06,59.07) ; v5(87.98,49.94) 89.76,49.94 90.71,50.88 v5(91.44,50.88) 93.9,50.88 96.11,48.67 97.89,48.67 98.19,48.97 v5(99.02,48.97) ; v5(13.06,51.06) 11.29,51.06 10.34,50.12 v5(9.6,50.12) 7.15,50.12 4.94,52.33 3.16,52.33 2.86,52.03 v5(2.02,52.03) ; v5(99.02,56.98) 98.19,56.98 97.89,56.68 96.11,56.68 93.9,58.89 v5(91.44,58.89) 90.71,58.89 89.76,57.95 v5(87.98,57.95) ; 33.37,41.91 R10#2.2
  Top Layer w0.45: U1.4 v5(46.16,5.2) 46.92,4.44 47.66,4.44 U1.6 49.25,6.03 49.25,7.62 v5(51.54,9.9) 54.25,9.9 54.91,10.56
  Top Layer w0.5: 48.65,56.56 45.34,56.56 v4(43.52,54.74) ; 35.54,26.79 31.22,26.79 29.93,25.5 IFX_A1.2 ; v5(40.24,4.82) 38.84,4.82 37.89,5.78 C9.2 35.28,6.73 34.28,7.73 R2#2.1 R1#2.1 R3#2.1 v5(33.13,12.44)
  Top Layer w0.65: v5(76.18,28.7) 74.12,26.64 IFX_B1.2
  Top Layer w0.8: v5(24.11,44.32) 24.11,43.31
  Top Layer w1: 28.81,41.91 34.52,41.91 35.54,40.89 ; 28.81,41.91 C5.1 ; 28.81,41.91 28.43,42.29 28.43,42.3 27.58,43.15 C4.2 23.39,43.15 ; 35.54,40.89 35.54,21.71 v7(40.36,16.89) ; 35.54,40.89 43.52,48.88 ; 43.52,48.88 v4(43.52,54.74) ; 43.52,48.88 45.16,47.24 v5(45.19,47.24)
  Bottom Layer w0.3: v5(13.06,59.07) 27.8,59.07 v5(27.82,59.09) ; v5(87.98,57.95) v5(73.23,57.95)
  Bottom Layer w0.5: 88.37,36.7 83.42,36.7 81.77,38.35 78.46,38.35 76.43,36.32 76.43,36.19 ; 88.37,36.7 89.39,37.72 91.29,37.72 93.07,35.94 v5(95.59,35.94) NOREF#62.1 ; 88.37,36.7 89.64,35.43 89.64,27.81 87.35,25.52 86.38,25.52 NOREF#59.1 ; v5(51.54,9.9) 44.56,16.89 v7(40.36,16.89) 38.86,16.89 34.41,12.44 v5(33.13,12.44) ; v5(5.46,37.08) 8.23,37.08 14.46,43.3 23.09,43.3 v5(24.11,44.32) ; v5(40.24,4.82) 41.63,4.82 42.02,5.2 v5(46.16,5.2) 46.52,4.84 46.52,3.17
  Bottom Layer w1: v5(76.18,28.7) 76.18,35.94 73,39.11 67.03,39.11 60.05,46.1 46.33,46.1 v5(45.19,47.24)
GND: length 586.7
  Top Layer w0.254: R8#2.2 71.1,38.85
  Top Layer w0.3: 46.21,72.19 46.21,74.14 ; 46.21,74.14 U8.9 ; 46.21,74.14 46.21,74.58 46.42,74.79 U8.8 ; R6.2 60.81,77.75 61.06,78 62.15,78 62.27,77.88 ; 54.84,74.14 54.84,74.58 54.63,74.79 U8.17 ; 54.84,74.14 54.84,73.7 54.63,73.49 U8.15 ; 54.84,74.14 U8.16 ; R5.2 40.24,77.75 39.98,78 38.9,78 38.78,77.88 ; 71.1,38.85 73.51,38.85
  Top Layer w0.35: v1(48.86,58.04) 49.27,57.62 FPC.2 ; v6(45.52,70.51) 47.12,68.92 49.06,68.92 49.27,68.7 FPC1.7 49.27,65.58
  Top Layer w0.4: 61.46,12.45 59.28,12.45 57,14.73 56.27,14.73 55,13.46 54.42,13.46 53.33,12.37 ; v5(30.88,78.05) 30.99,77.11 ; v5(15.33,75.67) R1.2 15.51,74.74 ; v6(45.52,70.51) 45.52,71.5 46.21,72.19 U8.12 ; v5(84.5,18.56) 79.33,18.56 78.34,19.55 IFX_B1.13 ; 91.23,73.61 v5(92.89,73.25) LED2.1 ; R10.2 v5(85.72,75.67) ; LED1#3.1 v5(8.15,73.25) R0.2 ; v5(38.73,78.73) 38.79,77.78 ; v5(23.08,77.03) 23.22,76.09 ; v5(88.55,43.3) SW2.2 ; 52.23,73.49 U8.15 ; 70.07,77.2 v5(70.16,78.05) ; 77.84,76.19 v5(77.97,77.03) ; 62.27,77.88 v5(62.32,78.73)
  Top Layer w0.45: 47.73,7.62 48.37,6.98 48.37,6.28 47.72,5.63 ; 47.73,7.62 47.44,7.62 U1.3 45.92,6.09 45.19,6.09 ; 47.73,7.62 51.03,10.92 51.88,10.92 53.33,12.37 ; 45.19,6.09 X1.2 ; 45.19,6.09 v5(43.92,7.36)
  Top Layer w0.5: v5(80.37,7.36) 80.37,5.33 83.95,1.75 SW0.2 ; C9.1 39.35,6.66 v5(39.35,5.84) ; 16.44,38.65 10.44,38.65 10.01,38.22 NOREF#34.1 ; v5(51.41,72.67) 52.23,73.49 50.02,75.7 50.02,78.89 v5(50.52,79.4) ; FPC1.9 FPC1.10 ; v5(90.66,36.19) 90.02,36.19 89.56,36.65 SW1.2 SW2.2 ; v1(48.86,58.04) 48.86,58.91 ; 48.86,58.91 v5(54.07,58.91) ; 48.86,58.91 FPC.10 ; Q1.3 73.51,38.85 v5(73.51,40.64)
  Top Layer w0.65: IFX_A1.9 27.93,19.05 26.93,18.05 IFX_A1.8 ; IFX_B1.11 74.12,18.05 73.12,19.05 IFX_B1.10 ; IFX_A1.10 28.93,19.05 29.93,18.05 IFX_A1.11 ; IFX_B1.8 71.12,18.05 72.12,19.05 IFX_B1.9
  Top Layer w1: C8.1 75.28,35.82 74.02,37.08 ; C6.1 23.6,28.24 ; C1.2 29.73,32.79 30.71,33.78 30.71,35.94 31.35,36.57 31.35,37.95 27.55,37.95 26.27,39.24 C4.1 ; v2(14.96,41.02) 26.19,41.02 26.21,41.03 ; 25.67,24.35 23.6,24.35 ; 67.92,28.24 C7.1 ; 69.87,24.35 67.92,24.35
  Top Layer w2: C1.2 26.81,32.79 23.6,29.59 23.6,19.34 ; 74.02,38.6 74.02,36.83 C2.2 70.62,35.33 67.92,32.64 67.92,20.06 v2(71.35,20.06)
  Top Layer w3: 28.43,20.19 25,20.19 23.29,18.48 23.29,8.19 17,1.9 15.98,1.9
  Bottom Layer w0.3: R30#2.1 9.6,60.12 9.38,60.34 4.68,60.34 4.4,60.06 v5(4.4,59.31) 4.4,58.41 3.6,57.61 S0#2.2 ; NOREF#49.1 11.17,52.21 10.35,51.39 R30#3.1 9.6,52.11 9.38,52.33 4.68,52.33 4.4,52.05 v5(4.4,51.3) 4.4,50.4 3.6,49.6 S0#3.2 ; 91.44,57.34 91.44,56.9 91.67,56.68 96.37,56.68 96.65,56.96 v5(96.65,57.71) 96.65,58.61 97.45,59.41 S1#3.2 ; 91.44,57.34 91.72,57.62 ; 91.44,57.34 R31#3.1 90.77,57.62 89.96,56.81 v5(73.23,56.81) ; 9.6,59.42 10.27,59.42 11.09,60.23 v5(27.82,60.23) ; NOREF#50.1 89.88,48.79 90.7,49.61 R31#2.1 91.44,48.89 91.67,48.67 96.37,48.67 96.65,48.95 v5(96.65,49.7) 96.65,50.6 97.45,51.4 S1#2.2
  Bottom Layer w0.4: v5(73.51,40.64) 73.51,41.36 75.46,43.3 ; 75.46,43.3 v5(88.55,43.3) ; 75.46,43.3 v5(73.29,45.47) ; v5(5.46,38.22) NOREF#16.1 ; v5(84.5,18.56) 84.5,16.57 80.37,12.44 v5(80.37,7.36)
  Bottom Layer w0.45: 32.95,77.57 32.83,78.65 ; S7.2 64.34,78.99 ; S11.2 95.44,73.88 ; S5.2 48.58,79.5 ; S9.2 80,77.11 ; S1.2 17.22,76.44
  Bottom Layer w0.5: v5(73.29,45.47) 68.69,45.47 67.54,44.32 63.99,44.32 60.81,47.49 48.91,47.49 45.52,50.88 ; C1#2.1 47.86,71.91 ; 47.86,71.91 46.92,71.91 v6(45.52,70.51) ; 47.86,71.91 50.65,71.91 v5(51.41,72.67) ; v5(8.15,73.25) 7.86,74.44 ; v5(92.89,73.25) 93.18,74.44 ; v4(45.52,54.74) 48.83,58.04 v1(48.86,58.04) ; NOREF#14.1 v5(95.59,34.79) 92.05,34.79 v5(90.66,36.19) ; v5(28.39,44.82) 28.39,41.03
  Bottom Layer w0.8: v5(23.08,77.03) 23.05,77.22 ; v5(30.88,78.05) 30.86,78.25 ; v5(15.33,75.67) 15.29,75.86 ; v5(62.32,78.73) 62.34,78.93 ; v5(70.16,78.05) 70.18,78.25 ; v5(39.35,5.84) 39.35,6.6 ; v5(77.97,77.03) 78,77.22 ; 43.92,6.6 v5(43.92,7.36) ; v5(38.73,78.73) 38.71,78.93 ; v5(85.72,75.67) 85.76,75.86
  Bottom Layer w1: v2(14.96,41.02) 28.37,41.02 28.39,41.03 29.57,39.85 34.5,39.85 45.52,50.88 v4(45.52,54.74) ; 48.52,3.17 48.52,5.17 47.09,6.6 21.7,6.6 16.84,1.75 VIN.2
  Bottom Layer w2: v2(29.7,20.06) v2(71.35,20.06)
VCC: length 46.1
  Top Layer w0.3: v5(51.92,75.34) 50.91,76.35 50.91,78.39 51.86,79.34 U8.24
  Top Layer w0.35: FPC1.8 47,67.93 45.7,69.23 44.81,69.23 v6(43.52,70.51)
  Top Layer w0.5: R30.1 3.91,70.48
  Bottom Layer w0.45: 94.48,70 94.74,71.01 ; 94.74,71.01 v5(96.1,70.73) ; 94.74,71.01 S11.3 ; 66.03,75.94 64.16,76.1 64.07,75 ; 33.25,74.67 S3.3 35.02,75.94 ; 50.52,76.61 S5.3 48.65,75.5 ; 81.42,73.93 S9.3 79.39,73.16 ; 56.37,75.42 S6.3 ; 17.98,72.51 S1.3 19.63,73.93 ; 71.75,74.24 S8.3 ; 86.97,71.74 S10.3 ; 40.94,75.25 40.88,76.36 ; 10.43,70.94 S0.3 ; 25.59,73.76 25.44,74.86 ; 4.43,70.73 4.75,69.52
  Bottom Layer w0.5: 43.54,75.34 43.52,75.32 v6(43.52,70.51) ; C1#2.2 47.86,75.46
  vias: v5(3.82,70.57)
(no net): length 109.7
  Top Layer w0.254: 98.88,13.1 99.04,13.1
  Top Layer w0.3: v2(1.26,15.25) 2.91,13.6 2.91,12.71 3.85,11.78 FPC#3.1
  Top Layer w0.35: 6.2,7 FPC#3.7 3.07,7 2.86,6.79 2.86,4.85 v2(1.26,3.25) ; FPC#3.6 2.81,7.5 2.34,7.03 2.34,6.33 v2(1.26,5.25) ; FPC#2.4 98.29,8 v4(99.04,7.25) ; v1(95.63,7.5) FPC#2.3 ; v1(95.73,6.58) 96.15,7 FPC#2.2 ; FPC#2.5 98.29,8.5 v4(99.04,9.25) ; v1(95.73,9.92) 96.15,9.5 FPC#2.7 ; v4(99.04,15.25) 97.21,13.43 FPC#2.8 ; v2(1.26,7.25) 2.01,8 FPC#3.5 ; v2(1.26,13.25) 2.86,11.65 2.86,9.71 3.07,9.5 FPC#3.2 ; v1(95.63,9) FPC#2.6 ; FPC#3.4 2.01,8.5 v2(1.26,9.25) ; FPC#3.3 2.81,9 2.34,9.47 2.34,10.17 v2(1.26,11.25)
  Top Layer w0.4: U1.13 54.76,5.33 55.99,5.33 ; NOREF#13.1 58.14,4.57 54.39,4.57 U1.12 ; NOREF#51.1 56.08,16.25 52.69,12.87
  Top Layer w0.5: 97.21,6.37 97.21,3.07 v4(99.04,1.25) ; FPC#3.10 FPC#3.9 ; FPC#2.10 94.86,6.58 ; 94.86,6.58 v1(95.73,6.58) ; 94.86,6.58 FPC#2.9 ; v2(1.26,1.25) 2.54,2.53 2.54,3.42 3.85,4.72 FPC#3.8
  Bottom Layer w0.35: v1(95.63,7.5) 96.79,7.5 v4(99.04,5.25) ; 99.04,13.1 98.92,13.1 v1(95.73,9.92) ; v4(99.04,11.25) 96.79,9 v1(95.63,9)
  Bottom Layer w0.5: v1(95.73,6.58) 95.73,6.55 v4(99.04,3.25)
  vias: v3(6.52,67.01) v3(94.52,67.01) v4(99.04,13.25)
$LED1_2: length 23.2
  Top Layer w0.3: LED1.2 6.17,57.71 7.09,56.79 v5(10.65,56.79) ; v5(10.65,48.78) 7.09,48.78 6.17,49.7 LED1#2.2
  Top Layer w0.45: R30.2 LED1#3.2
  Bottom Layer w0.3: v5(10.65,56.79) 10.65,58.82 11.02,59.19 R6#3.2 ; v5(10.65,48.78) 10.65,50.81 11.02,51.18 R6#2.2
$LED2_2: length 23.2
  Top Layer w0.3: v5(90.4,52.22) 93.95,52.22 94.88,51.3 LED2#2.2 ; LED2#3.2 94.88,59.31 93.95,60.23 v5(90.4,60.23)
  Top Layer w0.45: R31.2 94.64,73.67
  Bottom Layer w0.3: v5(90.4,52.22) 90.4,50.19 90.02,49.82 R7#2.2 ; R7#3.2 90.02,57.83 90.4,58.2 v5(90.4,60.23)
$LED3_2: length 1.9
  Top Layer w0.4: R4#2.2 63.06,10.59 LED3.2
$LED4_2: length 3.2
  Top Layer w0.3: R5#2.2 69.19,44.45 70.21,45.46 LED4.2
$LED5_2: length 3.1
  Top Layer w0.3: LED5.2 31.09,45.47 31.86,44.69 R10#2.1
$LED6_2: length 2
  Top Layer w0.45: LED6.2 37.78,10.54 R1#2.2
$LED7_2: length 2
  Top Layer w0.45: R2#2.2 37.78,8.63 LED7.2
$Q1_1: length 3
  Top Layer w0.3: R9#2.1 73.91,43.55 Q1.1
$R20_2: length 6.1
  Bottom Layer w0.3: R20#3.2 8.09,57.61 S0#2.1 ; R20.2 8.09,49.6 S0#3.1
  Bottom Layer w0.45: S0.1 4.01,72.33
$R21_2: length 6.1
  Bottom Layer w0.3: S1#3.1 92.96,59.41 R21#3.2 ; S1#2.1 92.96,51.4 R21#2.2
  Bottom Layer w0.45: S2.1 19.32,75.7
$R22_2: length 1.9
  Bottom Layer w0.45: S4.1 34.86,77.73
$R23_2: length 1.9
  Bottom Layer w0.45: S6.1 50.52,78.41
$R24_2: length 1.9
  Bottom Layer w0.45: 68.1,77.57 66.19,77.73
$R25_2: length 1.9
  Bottom Layer w0.45: S10.1 81.73,75.7
$S0_2: length 3.8
  Bottom Layer w0.45: S0.2 S1.1
$S2_2: length 3.8
  Bottom Layer w0.45: S2.2 S3.1
$S4_2: length 3.8
  Bottom Layer w0.45: S4.2 S5.1
$S6_2: length 3.8
  Bottom Layer w0.45: S6.2 60.28,78.16
$S8_2: length 3.8
  Bottom Layer w0.45: S8.2 S9.1
$S10_2: length 3.8
  Bottom Layer w0.45: S10.2 S11.1
$U1_7: length 4.5
  Top Layer w0.4: U1.7 47.9,3.55 45.57,3.55 45.02,4.1
$U1_8: length 10.1
  Top Layer w0.4: U1.8 48.15,2.66 44.17,2.66 42.4,4.44 42.4,5 X1.3
AREF: length 3.5
  Top Layer w0.4: U1.20 54.66,12.57 56.09,12.57 C10.1
B1/D11: length 55.9
  Top Layer w0.4: SW1.1 86.16,36.65 84.81,35.3 84.81,31.87 82.53,29.59 v5(82.53,25.78) ; v5(61.95,8.12) 60.43,6.6 55.75,6.6 U1.15
  Bottom Layer w0.4: v5(61.95,8.12) 63.35,9.52 72.24,9.52 75.99,13.27 78.28,13.27 82.53,17.52 82.53,19.13 NOREF#43.1 82.53,23.07 v5(82.53,25.78)
B2/D12: length 63.1
  Top Layer w0.4: v5(87.04,23.64) v5(81.38,23.64) 81.38,29.71 83.93,32.25 83.93,35.68 84.81,36.57 84.81,39.87 86.16,41.22 SW2.1 ; v5(60.05,8.63) 56.21,8.63 U1.16
  Bottom Layer w0.4: v5(60.05,8.63) 61.83,10.41 71.73,10.41 75.54,14.22 77.83,14.22 81.38,17.78 v5(81.38,23.64)
C0: length 14.1
  Top Layer w0.3: U8.1 48.68,79.34 49.13,78.89 49.13,75.46 50.52,74.07 50.52,71.51 v6(49.52,70.51)
  Top Layer w0.35: FPC1.5 50.27,69.76 v6(49.52,70.51)
C0/A4: length 51.4
  Top Layer w0.35: v4(49.52,54.74) 50.27,55.49 FPC.4
  Top Layer w0.4: U1.27 39.98,21.24 39.98,36.95 49.52,46.49 v4(49.52,54.74)
DIRA/D3: length 23.5
  Top Layer w0.4: v5(40.62,13.71) 40.62,14.73 33.25,22.09 33.25,23.24 32.13,24.35 30.94,24.35 ; U1.1 44.85,8.63 v5(44.17,8.63)
  Bottom Layer w0.4: v5(40.62,13.71) 41.13,13.2 41.13,11.68 v5(44.17,8.63)
DIRB/D4: length 42.9
  Top Layer w0.4: IFX_B1.1 75.12,25.86 v5(75.67,26.41) ; v5(64.88,23.11) 64.88,20.06 59.79,14.98 v5(58.14,14.98) ; U1.2 50.63,11.93 v5(51.41,11.93)
  Bottom Layer w0.4: v5(75.67,26.41) 74.02,28.06 69.83,28.06 v5(64.88,23.11) ; v5(51.41,11.93) 55.1,11.93 v5(58.14,14.98)
LED1/D2: length 78
  Top Layer w0.4: v5(42.78,8.25) 42.78,8.63 43.79,9.65 45.12,9.65 U1.32
  Bottom Layer w0.3: NOREF#60.1 12.17,48.78 11.79,49.16 R6#2.1 ; v5(27.82,56.81) 15.44,56.81 14.55,57.7 11.79,57.7
  Bottom Layer w0.4: NOREF#12.1 v5(5.46,34.79) 7.72,34.79 10.39,32.13 10.39,25.4 21.7,14.09 21.7,11.04 24.49,8.25 v5(42.78,8.25)
LED2/D7: length 84.8
  Top Layer w0.4: U1.11 54.02,3.81 59.79,3.81 65.26,9.27 78.84,9.27 88.37,18.79 88.37,26.54 89.64,27.81 89.64,33.4 91.93,35.68 91.93,36.7 93.45,38.22 v5(95.59,38.22)
  Bottom Layer w0.3: NOREF.1 88.87,52.22 89.25,51.84 R7#2.1 ; 89.25,59.34 86.57,59.34 85.67,60.23 v5(73.23,60.23)
LED3/D13: length 76.2
  Top Layer w0.4: v5(59.29,17.65) 62.34,20.7 62.34,31.62 68.05,37.33 68.05,39.75 69.19,40.89 R5#2.1 ; U1.17 56.17,9.39 57.64,9.39 v5(58.78,10.54) 61.5,10.54 R4#2.1 61.51,9.71 61.95,9.27 63.86,9.27 64.88,10.28 78.34,10.28 87.04,18.98 v5(87.04,21.1)
  Bottom Layer w0.4: v5(58.78,10.54) 58.78,12.19 60.43,13.84 60.43,16.51 v5(59.29,17.65)
OUT_A1: length 18.4
  Top Layer w0.65: 26.93,26.46 IFX_A1.5
  Bottom Layer w1: NOREF#45.1 18.78,34.54 v2(26.92,26.4)
OUT_A2: length 30.2
  Top Layer w0.65: v2(26.65,12.19) 25.93,12.91 IFX_A1.7
  Bottom Layer w1: NOREF#47.1 17.76,32 26.65,23.11 v2(26.65,12.19)
OUT_B1: length 23.6
  Top Layer w0.65: 71.12,26.46 IFX_B1.5
  Bottom Layer w1: v2(71.11,26.4) 72.62,24.89 76.7,24.89 79.23,27.41 79.23,28.95 84.81,34.54 NOREF#24.1
OUT_B2: length 30.7
  Top Layer w0.65: v2(70.84,12.19) 70.12,12.91 IFX_B1.7
  Bottom Layer w1: v2(70.84,12.19) 74.78,16.12 74.78,20.3 81,26.52 81,28.19 84.81,32 NOREF#33.1
OUT_C: length 5.1
  Top Layer w1: Q1.2 80.24,40.51 NOREF#30.1
P3: length 5.9
  Top Layer w0.35: v1(49.77,58.14) FPC.3
  Bottom Layer w0.3: v1(49.77,58.14) 49.77,56.99 v4(47.52,54.74)
P6: length 3.9
  Top Layer w0.35: FPC1.6 49.77,68.96 49.31,69.43 48.6,69.43 v6(47.52,70.51)
PWMA/D5: length 31.2
  Top Layer w0.4: v5(38.33,14.6) 37.32,13.59 33.38,13.59 32.21,14.75 30.94,14.75 ; U1.9 50.27,5.29 50.27,7.11 v5(51.92,8.76)
  Bottom Layer w0.4: v5(51.92,8.76) 50.91,8.76 43.92,15.74 39.47,15.74 v5(38.33,14.6)
PWMB/D6: length 31.5
  Top Layer w0.4: IFX_B1.12 75.12,12.23 v5(75.92,11.43) ; U1.10 53.65,3.04 60.3,3.04 63.22,5.97 65,5.97 v5(66.15,7.11)
  Bottom Layer w0.4: v5(75.92,11.43) 71.61,7.11 v5(66.15,7.11)
PWMC/D10: length 43.4
  Top Layer w0.3: R8#2.1 R9#2.2
  Top Layer w0.4: v5(53.57,8.63) 53.57,7.65 54.47,6.75 ; R8#2.1 70.2,40.37 69.19,39.37 69.19,36.7 63.1,30.6 63.1,19.81 v5(59.29,16)
  Bottom Layer w0.4: v5(53.57,8.63) 59.29,14.35 v5(59.29,16)
RESET: length 87.8
  Top Layer w0.4: R3#2.2 v5(37.82,12.44) 38.52,11.74 41.57,11.74 42.9,13.08 45.88,13.08 U1.29
  Top Layer w0.5: v5(87.43,1.75) SW0.1
  Bottom Layer w0.4: 54.52,5.27 54.52,3.17 ; 54.52,5.27 52.05,7.74 50.52,7.74 43.54,14.73 40.11,14.73 v5(37.82,12.44) ; 54.52,5.27 55.24,5.98 80.6,5.98 ; 80.6,5.98 84.84,1.75 v5(87.43,1.75) ; 80.6,5.98 81.89,7.27 81.89,10.83 87.04,15.97 NOREF#38.1
RX/D0: length 20.4
  Top Layer w0.45: U1.30 45.64,12.19 43.41,12.19 v5(42.78,11.55) 41.76,10.54 LED6.1
  Bottom Layer w0.4: 50.52,3.55 50.52,5.2 47.48,8.25 46.08,8.25 v5(42.78,11.55)
S0: length 18.3
  Top Layer w0.3: v5(49.25,73.94) 48.8,73.49 U8.10 ; v6(57.52,70.51) 55.87,68.86 54.98,68.86 54.05,67.93 FPC1.1
  Bottom Layer w0.3: v6(57.52,70.51) 53.71,74.32 49.63,74.32 v5(49.25,73.94)
S0/A0: length 52.9
  Top Layer w0.35: v4(57.52,54.74) 55.7,56.56 FPC.8
  Top Layer w0.4: U1.23 61.57,22.88 61.57,38.73 57.52,42.78 v4(57.52,54.74)
S1: length 14.9
  Top Layer w0.3: v5(49.63,72.92) 49.55,72.84 U8.11
  Top Layer w0.35: v6(55.52,70.51) 53.93,68.92 51.99,68.92 51.77,68.7 FPC1.2
  Bottom Layer w0.3: v5(49.63,72.92) 50.27,73.56 52.48,73.56 v6(55.52,70.51)
S1/A1: length 53.1
  Top Layer w0.35: 52.19,58.04 51.77,57.62 FPC.7
  Top Layer w0.4: U1.24 60.81,23.25 60.81,37.33 55.35,42.79 v4(55.35,54.48)
  Bottom Layer w0.3: v4(55.35,54.48) 52.19,57.64 v1(52.19,58.04)
S2: length 7.9
  Top Layer w0.3: v6(53.52,70.51) 54.84,71.83 54.84,72.54 54.55,72.84 U8.14
  Top Layer w0.35: v6(53.52,70.51) 52.44,69.43 51.74,69.43 51.27,68.96 FPC1.3
S2/A2: length 53.7
  Top Layer w0.35: v1(51.27,58.14) FPC.6
  Top Layer w0.4: v4(53.52,54.74) 53.52,42.46 60.05,35.94 60.05,24.58 U1.25
  Bottom Layer w0.3: v4(53.52,54.74) 51.27,56.99 v1(51.27,58.14)
S3: length 6.2
  Top Layer w0.3: v6(51.52,70.51) 51.52,71.51 52.2,72.19 U8.13
  Top Layer w0.35: v6(51.52,70.51) 50.77,69.76 FPC1.4
S3/A3: length 51.2
  Top Layer w0.35: FPC.5 50.77,55.49 v4(51.52,54.74)
  Top Layer w0.4: U1.26 40.87,21.48 40.87,35.81 51.52,46.46 v4(51.52,54.74)
TX/D1: length 18.7
  Top Layer w0.4: U1.31 v5(47.05,9.65)
  Top Layer w0.45: U1.31 45.4,11.3 44.05,11.3 41.38,8.64 LED7.1
  Bottom Layer w0.4: 52.52,3.55 52.52,5.74 51.54,6.73 50.27,6.73 47.35,9.65 v5(47.05,9.65)
VS: length 138.7
  Top Layer w0.65: C6.2 27.93,27.36 28.38,26.92 28.38,25.85 27.93,25.4 IFX_A1.4 ; C7.2 72.13,27.36 72.57,26.92 72.57,25.85 72.12,25.4 IFX_B1.4
  Top Layer w1: C6.2 30.12,28.24 32.62,30.73 v2(32.62,35.3) 33.63,36.32 33.63,39.11 32.72,40.03 C3.2 ; NOREF#22.1 80.23,33.76 C8.2 75.53,33.76 74.56,32.79 C2.1 72.52,30.76 72.13,30.36 C7.2
  Top Layer w1.5: VIN.1 12.9,7.21 14.58,8.89 19.16,8.89 v2(19.16,9.65)
  Top Layer w2: 23.65,38.35 23.65,36.81 25.12,35.33 C1.1
  Top Layer w3: 24.39,35.33 20.04,30.98 20.04,20.7 19.16,19.81 v2(19.16,9.65)
  Bottom Layer w2: C1.1 33.28,35.33 41.76,43.81 59.03,43.81 70.05,32.79 C2.1
Y0: length 44.2
  Top Layer w0.3: v5(8.32,71.56) 9.7,70.18 23.15,72.5 44.14,73.65 45.92,75.44 U8.7
  Top Layer w0.4: 8.42,71.74 R0.1
  Bottom Layer w0.5: 6.67,71.17 v5(8.32,71.56)
Y0/A5: length 96.4
  Top Layer w0.3: v5(7.46,51.39) 8.41,52.33 13.06,52.33 13.83,51.57 13.83,50.68 v5(13.06,49.92) ; v5(15.88,57.95) 13.47,60.36 8.41,60.36 7.46,59.42
  Top Layer w0.4: v5(39.73,12.7) 41.13,12.7 42.4,13.97 46.12,13.97 U1.28
  Bottom Layer w0.3: S0#3.4 6.03,51.39 v5(7.46,51.39) R30#3.2 ; v5(15.88,57.95) v5(27.82,57.95) ; R30#2.2 v5(7.46,59.4) 6.03,59.4 S0#2.4
  Bottom Layer w0.4: v5(39.73,12.7) 36.43,9.39 25.25,9.39 23.41,11.23 23.41,14.28 11.53,26.16 11.53,32.64 8.23,35.94 v5(5.46,35.94)
Y1: length 36
  Top Layer w0.3: U8.6 45.69,76.09 43.85,74.26 23.02,73.11 15.96,71.9 v5(14.84,73.02)
  Top Layer w0.4: v5(14.84,73.02) 15.81,73.22
  Bottom Layer w0.8: S1.4 v5(14.84,73.02)
Y1/A6: length 99.9
  Top Layer w0.3: v5(87.98,51.08) 87.22,50.32 87.22,49.43 87.98,48.67 92.64,48.67 v5(93.59,49.61) ; v5(93.59,57.62) 92.64,56.68 87.58,56.68 v5(85.17,59.09)
  Top Layer w0.4: v5(95.59,37.08) 93.58,37.08 92.81,36.32 92.81,35.3 90.53,33.02 90.53,27.17 89.39,26.03 89.39,18.28 79.35,8.25 65.76,8.25 v5(64.49,6.98) ; v5(57,10.54) 55.73,11.81 55.03,11.81 U1.19
  Bottom Layer w0.3: S1#2.4 95.01,49.61 v5(93.59,49.61) R31#2.2 ; R31#3.2 v5(93.59,57.62) 95.01,57.62 S1#3.4 ; v5(85.17,59.09) v5(73.23,59.09)
  Bottom Layer w0.4: v5(57,10.54) 57,9.78 59.79,6.98 v5(64.49,6.98)
Y2: length 28.4
  Top Layer w0.3: v5(22.48,74.4) 22.48,73.98 22.74,73.72 43.57,74.86 45.45,76.74 U8.5
  Top Layer w0.4: v5(22.48,74.4) 23.46,74.55
  Bottom Layer w0.8: S2.4 v5(22.48,74.4)
Y3: length 20.7
  Top Layer w0.3: U8.4 45.21,77.39 43.3,75.48 30.42,74.77 30.17,75.03 v5(30.17,75.45)
  Top Layer w0.4: v5(30.17,75.45) 31.16,75.56
  Bottom Layer w0.8: S3.4 v5(30.17,75.45)
Y4: length 11.3
  Top Layer w0.3: 38.88,76.38 43.31,76.38 44.97,78.04 U8.3
  Top Layer w0.4: v5(37.9,76.17) 38.89,76.23
  Bottom Layer w0.8: 36.89,76.1 v5(37.9,76.17)
Y5: length 7.2
  Top Layer w0.3: U8.2 44.73,78.69 43.79,77.75 R5.1
  Bottom Layer w0.3: v5(42.78,77.12) 43.37,76.53 S5.4
Y6: length 8.6
  Top Layer w0.3: v5(51.92,76.61) 51.92,78.26 52.35,78.69 U8.23 56.32,78.69 57.25,77.75 R6.1
Y7: length 10.3
  Top Layer w0.3: v5(61.17,76.3) 57.82,76.3 56.08,78.04 U8.22
  Top Layer w0.4: v5(61.17,76.3) 62.16,76.23
  Bottom Layer w0.8: 60.16,76.36 v5(61.17,76.3)
Y8: length 18.5
  Top Layer w0.3: v5(68.9,75.67) 68.15,74.91 57.75,75.48 55.84,77.39 U8.21
  Top Layer w0.4: v5(68.9,75.67) 69.89,75.56
  Bottom Layer w0.8: S8.4 v5(68.9,75.67)
Y9: length 26.2
  Top Layer w0.3: U8.20 55.6,76.74 57.48,74.85 75.75,73.85 v5(76.61,74.7)
  Top Layer w0.4: v5(76.61,74.7) 77.59,74.55
  Bottom Layer w0.8: 75.61,74.86 v5(76.61,74.7)
Y10: length 34
  Top Layer w0.3: U8.19 55.36,76.09 57.19,74.26 78.18,73.11 83.11,72.26 v5(84.26,73.41)
  Top Layer w0.4: v5(84.26,73.41) 85.23,73.22
  Bottom Layer w0.8: S10.4 v5(84.26,73.41)
Y11: length 38.9
  Top Layer w0.3: U8.18 55.12,75.44 56.92,73.64 78.06,72.48 88.37,70.7 v5(89.9,72.23)
  Top Layer w0.4: v5(89.9,72.23) 90.87,72

Small or netless copper shapes (teardrops, artwork), in the pictures only: 4 on Bottom Layer

## Text on the board
Bottom Layer: 09/12/2024
Bottom Silkscreen Layer: D11 | D12 | D13 | 5V | MOSI | GND | MISO | SCK | RST | VISION 2
Top Silkscreen Layer: + | - | EVA-RT
